# EAGLE design untitled (EAGLE 9.6.2)
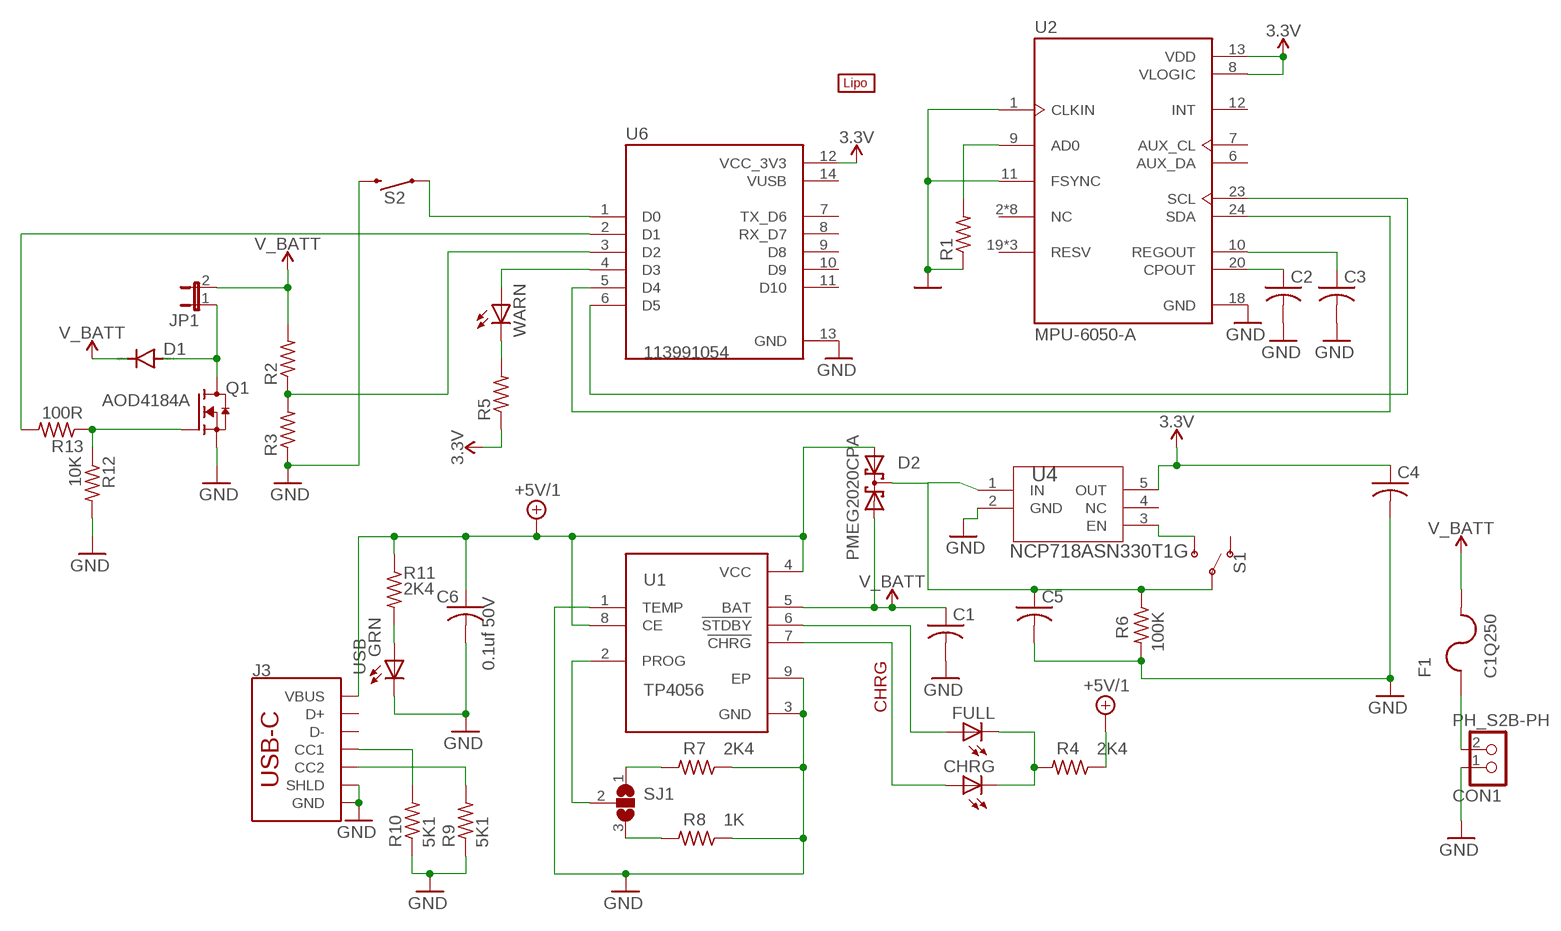
[diagram p0: schematic, sheet 1]

## Parts
BT1  LIPO-OUTLINE1000  [LIPO-1000]
C1  C-USC0603  [C0603]
C2  C-USC0603  [C0603]
C3  C-USC0603  [C0603]
C4  C-USC0603  [C0603]
C5  C-USC0603  [C0603]
C6  0.1uf 50V  C-USC0805  [C0805]
CHRG  LEDCHIPLED_0603  [CHIPLED_0603]
CON1  PH_S2B-PH  [S2B-PH]
D1  DIODE-DO-214AC  [DO-214AC]
D2  PMEG2020CPA  [SOT1061]
F1  C1Q250  [C1Q250]
FULL  LEDCHIPLED_0603  [CHIPLED_0603]
J3  USB Female Type C Connector  USB_C_4-LAYER-ISOLATED  [USB-C-16P-4LAYER-ISOLATED]
JP1  JP1E  [JP1]
Q1  AOD4184A  [DPAK228P994X240-4N]
R1  R-US_R0805  [R0805]
R2  R-US_R0805  [R0805]
R3  R-US_R0805  [R0805]
R4  2K4  R-US_R0603  [R0603]
R5  R-US_R0805  [R0805]
R6  100K  R-US_R0603  [R0603]
R7  2K4  R-US_R0603  [R0603]
R8  1K  R-US_R0603  [R0603]
R9  5K1  R-US_R0603  [R0603]
R10  5K1  R-US_R0603  [R0603]
R11  2K4  R-US_R0603  [R0603]
R12  10K  R-US_R0805  [R0805]
R13  100R  R-US_R0805  [R0805]
S1  SWITCH-SPDT-SMD-RIGHT-ANGLE  [SWITCH_SPST_SMD_A]
S2  MOMENTARY-SWITCH-SPST-PTH-12MM  [TACTILE_SWITCH_PTH_12MM]
SJ1  SJ2W  [SJ_2]
U1  TP4056  [SOP127P600X175-9N]
U2  MPU-6050-A  [QFN50P400X400X95-24N]
U4  NCP718ASN330T1G  [TSOT23-5_ONS]
U6  113991054  [MODULE_113991054]
USB  GRN  LEDCHIPLED_0805  [CHIPLED_0805]
WARN  LEDCHIPLED_0603  [CHIPLED_0603]

## Nets
3.3V: C4.1 R5.1 U2.8(VLOGIC) U2.13(VDD) U4.5(OUT) U6.12(VCC_3V3)
+5V/1: C6.1 D2.1(A1) J3.VBUS1(VBUS) J3.VBUS2(VBUS) R4.1 R11.1 U1.4(VCC) U1.8(CE)
CHRG: CHRG.A U1.7(!CHRG)
FULL: FULL.A U1.6(!STDBY)
GND: C1.2 C2.2 C3.2 C4.2 C5.2 C6.2 CON1.1 J3.GND J3.GND2(GND) J3.SHLD1(SHLD) J3.SHLD2(SHLD) J3.SHLD3(SHLD) J3.SHLD4(SHLD) J3.SHLD5(SHLD) J3.SHLD6(SHLD) J3.SHLD7(SHLD) J3.SHLD8(SHLD) Q1.3(S) R1.1 R3.1 R6.2 R7.1 R8.1 R9.1 R10.1 R12.2 S2.3 U1.1(TEMP) U1.3(GND) U1.9(EP) U2.1(CLKIN) U2.11(FSYNC) U2.18(GND) U4.2(GND) U6.13(GND) USB.C
N$1: C5.1 D2.3(K1K2) R6.1 S1.2(P) U4.1(IN)
N$2: CHRG.C FULL.C R4.2
N$3: U2.23(SCL) U6.6(D5)
N$4: R13.2 U6.2(D1)
N$5: R2.1 R3.2 U6.3(D2)
N$6: S2.1 U6.1(D0)
N$7: U2.24(SDA) U6.5(D4)
N$8: C3.1 U2.10(REGOUT)
N$9: C2.1 U2.20(CPOUT)
N$10: D1.A JP1.1 Q1.4(D)
N$11: CON1.2 F1.1
N$12: R1.2 U2.9(AD0)
N$13: R5.2 WARN.C
N$14: U6.4(D3) WARN.A
N$15: S1.3(S) U4.3(EN)
N$16: J3.A5(CC1) R10.2
N$18: R7.2 SJ1.1
N$19: J3.B5(CC2) R9.2
N$21: R8.2 SJ1.3
N$22: SJ1.2 U1.2(PROG)
N$26: R11.2 USB.A
N$41: Q1.1(G) R12.1 R13.1
V_BATT: C1.1 D1.C D2.2(A2) F1.2 JP1.2 R2.2 U1.5(BAT)
Unconnected: J3.A6(D+) J3.A7(D-) J3.B6(D+) J3.B7(D-) S1.1(O) U2.2(NC) U2.3(NC) U2.4(NC) U2.5(NC) U2.6(AUX_DA) U2.7(AUX_CL) U2.12(INT) U2.14(NC) U2.15(NC) U2.16(NC) U2.17(NC) U2.19(RESV) U2.21(RESV) U2.22(RESV) U4.4(NC) U6.7(TX_D6) U6.8(RX_D7) U6.9(D8) U6.10(D9) U6.11(D10)

## Power pins joined to a net without a drawn wire
VUSB: U6.14(VUSB)

## Library data of the parts
BT1 = SparkFun-Batteries:LIPO-OUTLINE: LiPo Battery Outlines Outlines for common LiPo batteries sold by SparkFun. (Note: no terminals or connection points, just the dimensions.) SparkFun Products Polymer Lithium Ion Battery - 110mAh <https://www.sparkfun.com/products/13853> (PRT-13853) Polymer Lithium Ion Battery - 1000mAh <https://www.sparkfun.com/products/13813> (PRT-13813) Polymer Lithium Ion Battery - 2000mAh <https://www.sparkfun.com/products/8483> (PRT-08483); PROD_ID: BATT-13243; SF_SKU: PRT-13813
C1-C5 = adafruit:C-US: CAPACITOR, American symbol
C6 = rcl:C-US: CAPACITOR, American symbol; SPICEPREFIX: C
CHRG FULL USB WARN = adafruit:LED: LED OSRAM: - CHIPLED LG R971, LG N971, LY N971, LG Q971, LY Q971, LO R971, LY R971 LH N974, LH R974 LS Q976, LO Q976, LY Q976 LO Q996 - Hyper CHIPLED LW Q18S LB Q993, LB Q99A, LB R99A - SideLED LS A670, LO A670, LY A670, LG A670, LP A670 LB A673, LV A673, LT A673, LW A673 LH A674 LY A675 LS A676, LA A676, LO A676, LY A676, LW A676 LS A679, LY A679, LG A679 - Hyper Micro SIDELED® LS Y876, LA Y876, LO Y876, LY Y876 LT Y87S - SmartLED LW L88C, LW L88S LB L89C, LB L89S, LG L890 LS L89K, LO L89K, LY L89K LS L896, LA L896, LO L896, LY L896 - TOPLED LS T670, LO T670, LY T670, LG T670, LP T670 LSG T670, LSP T670, LSY T670, LOP T670, LYG T670 LG T671, LOG T671, LSG T671 LB T673, LV T673, LT T673, LW T673 LH T674 LS T676, LA T676, LO T676, LY T676, LB T676, LH T676, LSB T676, LW T676 LB T67C, LV T67C, LT T67C, LS T67K, LO T67K, LY T67K, LW E67C LS E67B, LA E67B, LO E67B, LY E67B, LB E67C, LV E67C, LT E67C LW T67C LS T679, LY T679, LG T679 LS T770, LO T770, LY T770, LG T770, LP T770 LB T773, LV T773, LT T773, LW T773 LH T774 LS E675, LA E675, LY E675, LS T675 LS T776, LA T776, LO T776, LY T776, LB T776 LHGB T686 LT T68C, LB T68C - Hyper Mini TOPLED® LB M676 - Mini TOPLED Santana® LG M470 LS M47K, LO M47K, LY M47K Source: http://www.osram.convergy.de/
CON1 = CASE-JST:PH_S2B-PH: JST PH Connector, through hole, 2 pin, side entry Description: JST PH connector with 2.0 mm pitch, through hole version, 2 pin, side entry. Links: Datasheet <http://www.jst-mfg.com/product/pdf/eng/ePH.pdf>
D1 = diode:DIODE-: DIODE
D2 = PMEG2020CPA:PMEG2020CPA: Check availability <https://pricing.snapeda.com/parts/PMEG2020CPA/Nexperia/view-part?ref=eda>; AVAILABILITY: In Stock; CHECK_PRICES: https://www.snapeda.com/parts/PMEG2020CPA/Nexperia/view-part/?ref=eda; DESCRIPTION: Diode Array 1 Pair Common Cathode Schottky 20V 2A Surface Mount 3-PowerUDFN; MF: Nexperia; MP: PMEG2020CPA; PACKAGE: PowerUDFN-3 NXP Semiconductors; PRICE: None; SNAPEDA_LINK: https://www.snapeda.com/parts/PMEG2020CPA/Nexperia/view-part/?ref=snap
F1 = Fuse:C1Q250: FUSE BRD MNT 250MA 125VAC 63VDC Manufacturer's datasheet <https://belfuse.com/resources/datasheets/circuitprotection/ds-cp-c1q-series.pdf>; CREATED_BY: PCBLayout.com; DIGIKEY_PARTNO: 507-1073-1-ND; MANUFACTURER: Bel Fuse Inc.; MPN: C1Q 250
J3 = SparkFun-Connectors:USB_C: USB Type C 16Pin Connector Super Speed pins not available on the 16-pin purely SMD connector so this part is best for USB 2.0 implementations. D1 and D2 are tied together enabling D+/- no matter which way the cable is plugged into the connector. The two channel configuration pins (CC1/2) are exposed. These are normally connected to ground via 5.1k resistors but can be reconfigured for high current/high power applications. **4-LAYER BOARD WARNING!!** If designing 4-layer board, make sure to select the variant _4-LAYER-ISOLATED. The linked footprint (USB-C-16-4LAYER-ISOLATED) includes some very necessary cutout polygons in the inner layers (2 and 15). This prevents the PTH mounting shield legs on the USB connector from electrically connecting any other polygons on the inner layers (usually VCC and GND).; PROD_ID: CONN-14122
JP1 = jumper:JP1E: JUMPER
Q1 = AOD4184A:AOD4184A: Trans MOSFET N-CH 40V 50A 3-Pin(2+Tab) DPAK Check availability <https://pricing.snapeda.com/parts/AOD4184A/Alpha%20%26%20Omega%20Semiconductor%20Inc./view-part?ref=eda>; AVAILABILITY: In Stock; CHECK_PRICES: https://www.snapeda.com/parts/AOD4184A/Alpha+%2526+Omega+Semiconductor+Inc./view-part/?ref=eda; DESCRIPTION: N-Channel 40 V 13A (Ta), 50A (Tc) 2.3W (Ta), 50W (Tc) Surface Mount TO-252 (DPAK); MF: Alpha & Omega Semiconductor Inc.; MP: AOD4184A; PACKAGE: None; PRICE: None; SNAPEDA_LINK: https://www.snapeda.com/parts/AOD4184A/Alpha+%2526+Omega+Semiconductor+Inc./view-part/?ref=snap
R1-R3 R5 R9 R10 R12 R13 = adafruit:R-US_: RESISTOR, American symbol
R4 R6-R8 R11 = rcl:R-US_: RESISTOR, American symbol; SPICEPREFIX: R
S1 = SparkFun-Switches:SWITCH-SPDT: Single Pole, Double Throw (SPDT) Switch Single-pole, double-throw (SPDT) switch. Variant Overview SMD-AYZ0202 Surface Mount DPDT Switch <https://www.sparkfun.com/products/597> (COM-00597) Used on e.g. LilyPad Arduino USB - ATmega32U4 Board <https://www.sparkfun.com/products/12049> PTH-11.6X4.0MM SPDT Mini Power Switch <https://www.sparkfun.com/products/102> (COM-00102) Used on e.g. SparkFun Simon Says - Through-Hole Soldering Kit <https://www.sparkfun.com/products/10547> (KIT-10547) PTH-11.6X4.0MM-KIT KIT version of SPDT Mini Power Switch - Simplifies soldering by removing tStop of switch pins - only one side can be soldered. PTH-11.6X4.0MM-LOCK LOCK version of SPDT Mini Power Switch - Offset pins hold switch in place for easier soldering. SMD-RIGHT-ANGLE Surface Mount Right Angle Switch <https://www.sparkfun.com/products/10860> (COM-10860) Used on e.g. SparkFun ESP8266 Thing <https://www.sparkfun.com/products/13231>; PROD_ID: SWCH-10651; SF_SKU: COM-10860
S2 = SparkFun-Switches:MOMENTARY-SWITCH-SPST: Momentary Switch (Pushbutton) - SPST Normally-open (NO) SPST momentary switches (buttons, pushbuttons). Variants PTH-12MM - 12mm square, through-hole Momentary Pushbutton Switch - 12mm Square <https://www.sparkfun.com/products/9190> (COM-09190) PTH-6.0MM, PTH-6.0MM-KIT - 6.0mm square, through-hole Mini Pushbutton Switch <https://www.sparkfun.com/products/97> (COM-00097) KIT package intended for soldering kit's - only one side of pads' copper is exposed. PTH-RIGHT-ANGLE-KIT - Right-angle, through-hole Right Angle Tactile Button <https://www.sparkfun.com/products/10791> - Used on SparkFun BigTime Watch Kit <https://www.sparkfun.com/products/11734> SMD-12MM - 12mm square, surface-mount Tactile Button - SMD (12mm) <https://www.sparkfun.com/products/12993> (COM-12993) Used on SparkFun PicoBoard <https://www.sparkfun.com/products/11888> SMD-4.5MM - 4.5mm Square Trackball Switch Used on SparkFun Blackberry Trackballer Breakout <https://www.sparkfun.com/products/13169> SMD-4.6MMX2.8MM - 4.60mm x 2.80mm, surface mount Used on SparkFun Pro Micro - RP2040 <https://www.sparkfun.com/products/17717> SMD-5.2MM, SMD-5.2-REDUNDANT - 5.2mm square, surface-mount Mini Pushbutton Switch - SMD <https://www.sparkfun.com/products/8720> (COM-08720) Used on Arduino Pro Mini <https://www.sparkfun.com/products/11114> REDUNDANT package connects both switch circuits together SMD-6.0X3.5MM - 6.0 x 3.5mm, surface mount Momentary Reset Switch SMD <https://www.sparkfun.com/products/8229> (COM-08229) SMD-6.2MM-TALL - 6.2mm square, surface mount Tactile Button - SMD (6mm) <https://www.sparkfun.com/products/12992> Used on SparkFun Digital Sandbox <https://www.sparkfun.com/products/12651> SMD-RIGHT-ANGLE - Right-angle, surface mount Used on SparkFun Block for Intel® Edison - Arduino <https://www.sparkfun.com/products/13036>; PROD_ID: SWCH-09185; SF_SKU: COM-09190
SJ1 = jumper:SJ2W: SMD solder JUMPER
U1 = TP4056 (1):TP4056: Complete single cell Li-Ion battery with a constant current / constant voltage linear charger Check availability <https://pricing.snapeda.com/parts/TP4056/NanJing%20Top%20Power%20ASIC%20Corp./view-part?ref=eda>; AVAILABILITY: Not in stock; CHECK_PRICES: https://www.snapeda.com/parts/TP4056/NanJing+Top+Power+ASIC+Corp./view-part/?ref=eda; DESCRIPTION: Complete single cell Li-Ion battery with a constant current / constant voltage linear charger; MF: NanJing Top Power ASIC Corp.; MP: TP4056; PACKAGE: Package; PRICE: None; SNAPEDA_LINK: https://www.snapeda.com/parts/TP4056/NanJing+Top+Power+ASIC+Corp./view-part/?ref=snap
U2 = MPU-6050-A:MPU-6050-A: Check availability <https://pricing.snapeda.com/parts/MPU-6050-A/TDK%20InvenSense/view-part?ref=eda>; AVAILABILITY: In Stock; CHECK_PRICES: https://www.snapeda.com/parts/MPU-6050-A/TDK/view-part/?ref=eda; DESCRIPTION: MOTION TRACKING DEVICE; MF: TDK InvenSense; MP: MPU-6050-A; PACKAGE: QFN-24 InvenSense; PRICE: None; SNAPEDA_LINK: https://www.snapeda.com/parts/MPU-6050-A/TDK/view-part/?ref=snap
U4 = NCP718ASN330T1G:NCP718ASN330T1G: Check availability <https://pricing.snapeda.com/parts/NCP718ASN330T1G/onsemi/view-part?ref=eda>; AVAILABILITY: In Stock; CHECK_PRICES: https://www.snapeda.com/parts/NCP718ASN330T1G/Onsemi/view-part/?ref=eda; DESCRIPTION: Linear Voltage Regulator IC Positive Fixed 1 Output 300mA TSOT-23-5; MF: onsemi; MP: NCP718ASN330T1G; PACKAGE: TSOT-23-5 ON Semiconductor; PRICE: None; SNAPEDA_LINK: https://www.snapeda.com/parts/NCP718ASN330T1G/Onsemi/view-part/?ref=snap
U6 = 113991054:113991054: Check availability <https://pricing.snapeda.com/parts/113991054/Seeed%20Technology%20Co.%2C%20Ltd/view-part?ref=eda>; AVAILABILITY: In Stock; CHECK_PRICES: https://www.snapeda.com/parts/113991054/Seeed+Studio/view-part/?ref=eda; DESCRIPTION: - ESP32-C3 Transceiver; 802.11 a/b/g/n (Wi-Fi, WiFi, WLAN), Bluetooth® Smart 4.x Low Energy (BLE) 2.4GHz Evaluation Board; MF: Seeed Technology Co., Ltd; MP: 113991054; PACKAGE: None; PRICE: None; SNAPEDA_LINK: https://www.snapeda.com/parts/113991054/Seeed+Studio/view-part/?ref=snap

## Board
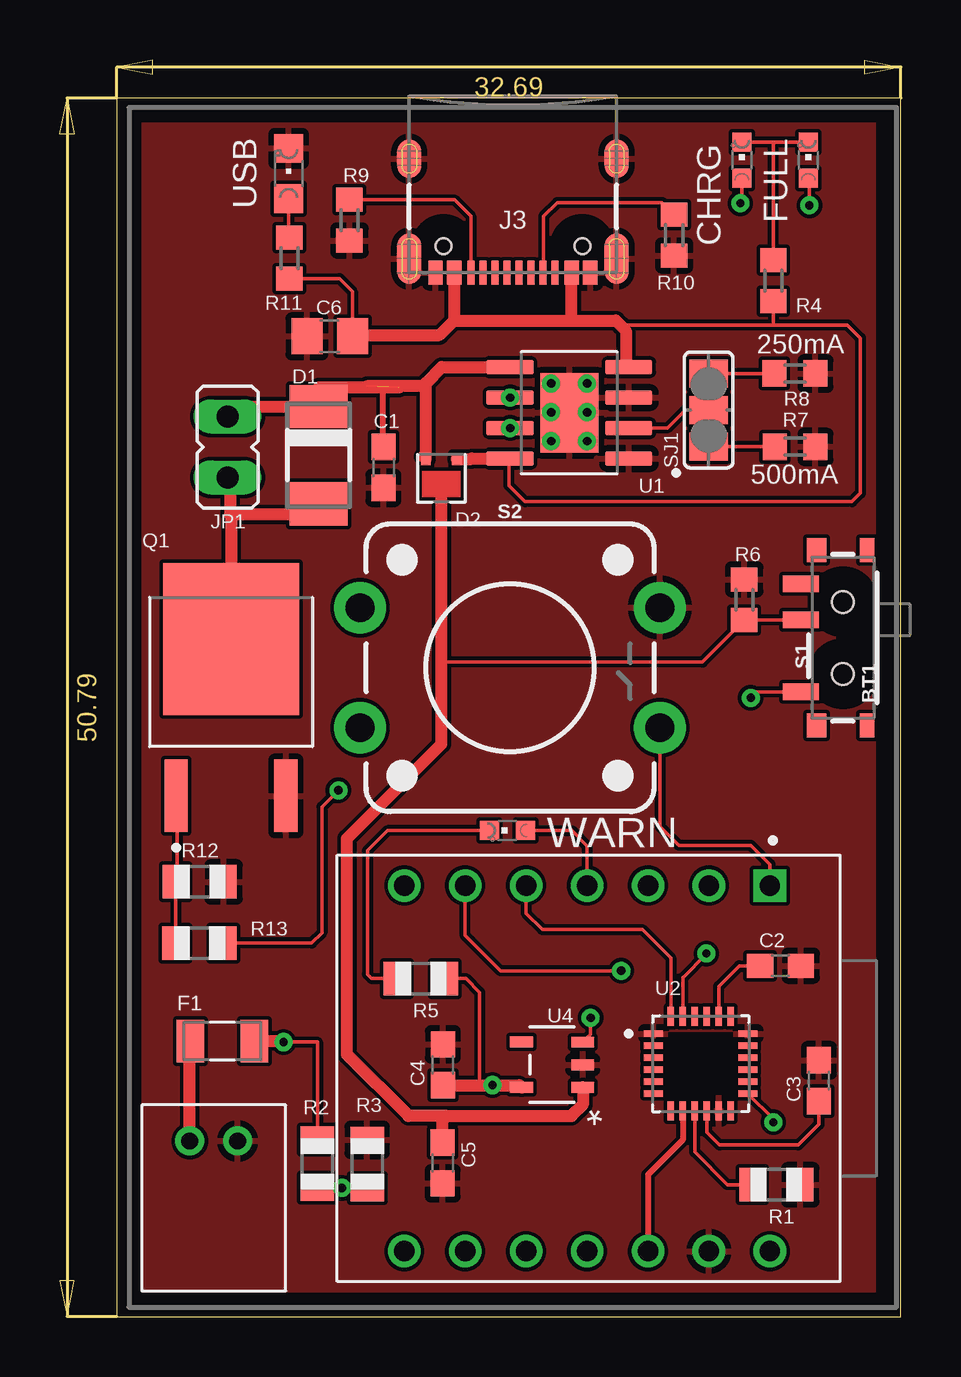
[diagram p1: board, top side]
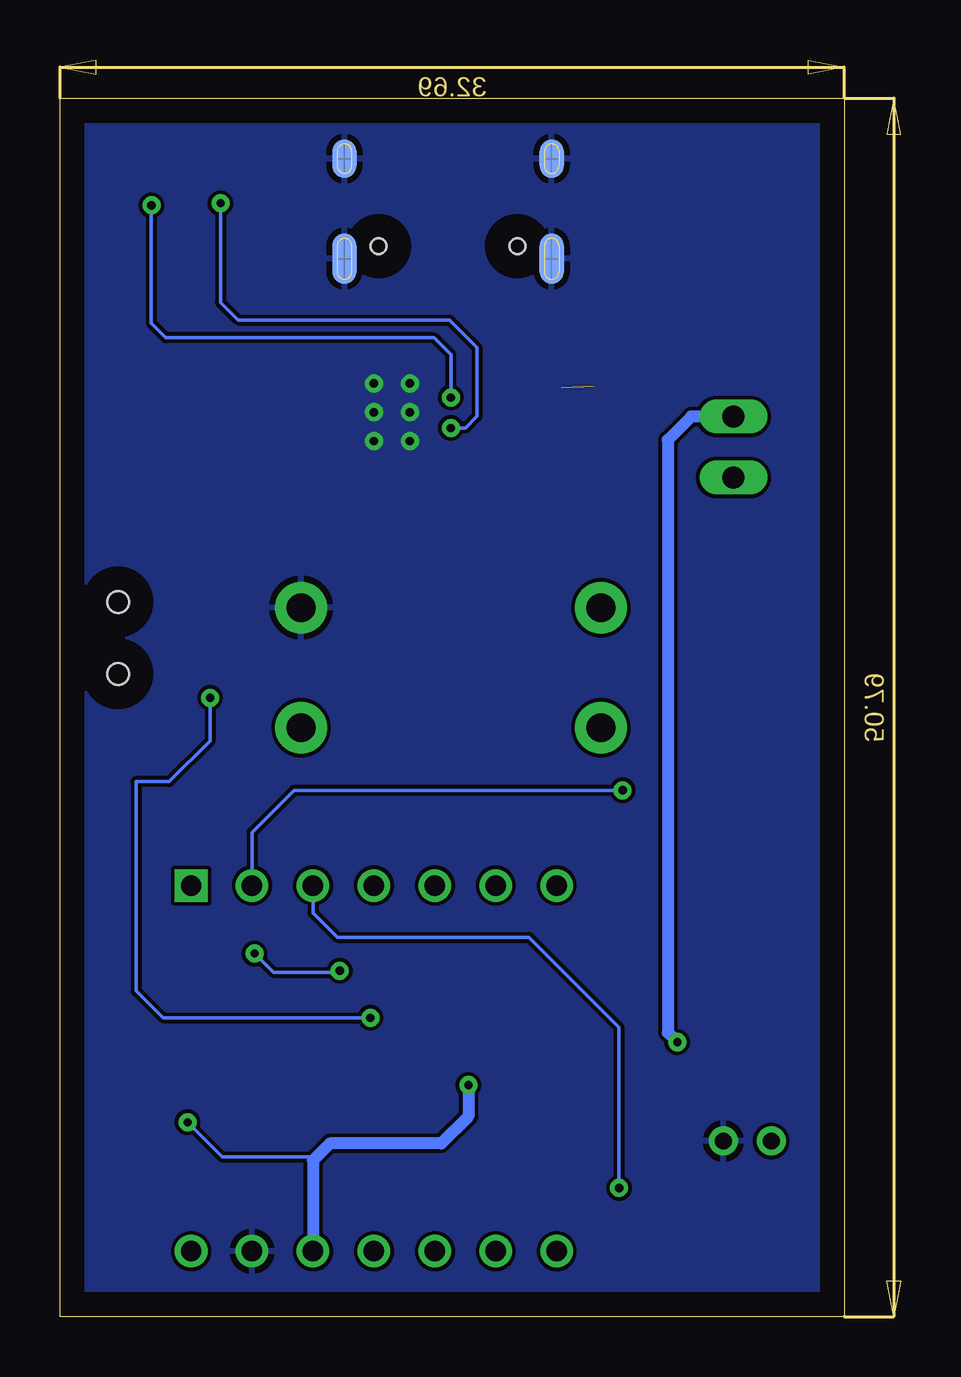
[diagram p2: board, bottom side, seen from below]

Size 32.69 x 50.79 mm. Coordinates in mm from the lower left corner, seen from the top.
Outline: 0,0 32.69,0 32.69,50.79 0,50.79 0,0
Copper layers (1*16): Top 0.035mm / dielectric 1.5mm / Bottom 0.035mm
Design rules "default": minimum track width 6mil, minimum drill 0.35mm, track to track 6mil, track to pad 6mil, pad to pad 6mil, via to via 6mil, smd to smd 6mil, copper to edge 40mil, drill to drill 6mil, minimum pad ring 10mil, minimum via ring 8mil, stop-mask expansion 4mil, vias tented up to drill 0mil, thermal gap 10mil

### Footprints (pad centres in the part's own frame; a part is rotated, then mirrored left to right if it is on the bottom)
C0603 = smd 1.1 x 1: 1 -0.85,0; 2 0.85,0
C0805 = smd 1.3 x 1.5: 1 -0.95,0; 2 0.95,0
CHIPLED_0603 = smd 0.8 x 0.8: A 0,-0.75; C 0,0.75
S2B-PH = drill 0.7: 1 -1,0; 2 1,0
DO-214AC = smd 1.8 x 2.4: A 2.025,0; C -2.025,0
SOT1061 = smd 0.4 x 0.5: 1 -0.65,-0.8; 2 0.65,-0.8 | smd 0 x 0: 3 0,0.875
C1Q250 = smd 1.14 x 1.78: 1 -1.33,0; 2 1.33,0
USB-C-16P-4LAYER-ISOLATED = smd 0.3 x 1: A5 -1.25,-0.34; A6 -0.25,-0.34; A7 0.25,-0.34; A8 1.25,-0.34; B5 1.75,-0.34; B6 0.75,-0.34; B7 -0.75,-0.34; B8 -1.75,-0.34 | smd 0.6 x 1: GND -3.225,-0.34; GND2 3.225,-0.34; VBUS1 -2.45,-0.34; VBUS2 2.45,-0.34 | smd 1 x 2.1: SHLD1 -4.32,-0.915; SHLD2 4.32,-0.915 | smd 1 x 2.1 bottom: SHLD3 -4.32,-0.915; SHLD4 4.32,-0.915 | smd 1 x 1.6: SHLD5 -4.32,-5.095; SHLD8 4.32,-5.095 | smd 1 x 1.6 bottom: SHLD6 -4.32,-5.095; SHLD7 4.32,-5.095 | hole 0.65: -2.89,-1.445; 2.89,-1.445
JP1 = drill 0.914 long: 1 0,-1.27; 2 0,1.27
DPAK228P994X240-4N = smd 0.97 x 3.02: 1 -2.286,-4.09; 3 2.286,-4.09 | smd 5.67 x 6.32: 4 0,2.44
R0805 = smd 1.1 x 1.4: 1 -1,0; 2 1,0
R0603 = smd 1 x 1.1: 1 -0.85,0; 2 0.85,0
SWITCH_SPST_SMD_A = smd 0.7 x 1.5: 1 -2.25,-1.75; 2 -0.75,-1.75; 3 2.25,-1.75 | smd 1 x 0.6: GND1 -3.65,1; GND3 3.65,1 | smd 1 x 0.8: GND2 -3.65,-1.1; GND4 3.65,-1.1 | hole 0.9: -1.5,0; 1.5,0
TACTILE_SWITCH_PTH_12MM = drill 1.2 pad 2.159: 1 6.25,-2.5; 2 -6.25,-2.5; 3 6.25,2.5; 4 -6.25,2.5
SJ_2 = smd 1.168 x 1.6: 1 -1.524,0; 2 0,0; 3 1.524,0
SOP127P600X175-9N = smd 1.97 x 0.6: 1 -2.475,1.905; 2 -2.475,0.635; 3 -2.475,-0.635; 4 -2.475,-1.905; 5 2.475,-1.905; 6 2.475,-0.635; 7 2.475,0.635; 8 2.475,1.905 | smd 2.413 x 3.302: 9 0,0
QFN50P400X400X95-24N = smd 0.79 x 0.28: 1 -1.97,1.25; 2 -1.97,0.75; 3 -1.97,0.25; 4 -1.97,-0.25; 5 -1.97,-0.75; 6 -1.97,-1.25; 13 1.97,-1.25; 14 1.97,-0.75; 15 1.97,-0.25; 16 1.97,0.25; 17 1.97,0.75; 18 1.97,1.25 | smd 0.28 x 0.79: 7 -1.25,-1.97; 8 -0.75,-1.97; 9 -0.25,-1.97; 10 0.25,-1.97; 11 0.75,-1.97; 12 1.25,-1.97; 19 1.25,1.97; 20 0.75,1.97; 21 0.25,1.97; 22 -0.25,1.97; 23 -0.75,1.97; 24 -1.25,1.97
TSOT23-5_ONS = smd 0.953 x 0.457: 1 -1.276,0.94; 2 -1.276,0; 3 -1.276,-0.94; 4 1.276,-0.953; 5 1.276,0.953
MODULE_113991054 = drill 0.85 square: 1 -7.62,7.556 | drill 0.85: 2 -7.62,5.016; 3 -7.62,2.477; 4 -7.62,-0.064; 5 -7.62,-2.603; 6 -7.62,-5.144; 7 -7.62,-7.684; 8 7.62,-7.684; 9 7.62,-5.144; 10 7.62,-2.603; 11 7.62,-0.064; 12 7.62,2.477; 13 7.62,5.016; 14 7.62,7.556
CHIPLED_0805 = smd 1.2 x 1.2: A 0,-1.05; C 0,1.05

### Placement (x,y rotation side)
BT1  16.51,25.4 0 top
C1  11.11,35.4 270 top
C2  27.66,14.63 0 top
C3  29.27,9.84 90 top
C4  13.59,10.5 90 top
C5  13.58,6.41 270 top
C6  8.88,40.86 180 top
CHRG  26.05,48.21 0 top
CON1  4.04,7.32 180 top
D1  8.41,35.91 270 top
D2  13.53,34.95 180 top
F1  4.4,11.49 0 top
FULL  28.82,48.21 0 top
J3  16.51,43.18 180 top
JP1  4.61,36.25 0 top
Q1  4.76,25.8 0 top
R1  27.49,5.5 180 top
R2  8.37,6.38 90 top
R3  10.43,6.37 270 top
R4  27.37,43.19 90 top
R5  12.66,14.1 180 top
R6  26.16,29.88 90 top
R7  28.27,36.26 180 top
R8  28.27,39.31 180 top
R9  9.7,45.71 90 top
R10  23.23,45.08 90 top
R11  7.2,44.12 90 top
R12  3.45,18.13 0 top
R13  3.45,15.58 0 top
S1  30.27,28.3 270 top
S2  16.39,27.05 0 top
SJ1  24.67,37.79 90 top
U1  18.87,37.68 180 top
U2  24.34,10.55 0 top
U4  18.15,10.51 180 top
U6  19.67,10.35 270 top
USB  7.16,47.65 0 top
WARN  16.28,20.27 90 top

### Tracks (layer width: path | path; a pad name or v marks a point on that pad's centre or on a via)
3.3V  (via drill 0.35)
  Top 0.152: R5.1 14.55,14.1 15.12,13.53 15.12,9.65 | U2.13 27.37,8.24 v27.37,8.1
  Top 0.254: U2.8 23.59,7.37 22.14,5.92 U6.12
  Top 0.508: C4.1 15.12,9.65 v15.66,9.65 16.77,9.65 U4.5
  Bottom 0.152: v27.37,8.1 25.93,6.66 22,6.66
  Bottom 0.508: v15.66,9.65 15.66,8.36 16.8,7.23 21.43,7.23 22,6.66 22.14,6.52 U6.12
+5V/1
  Top 0.152: 16.34,35.77 16.34,34.65 17.02,33.97 30.64,33.97 31,34.33 31,40.8 30.46,41.34 27.32,41.34 | R11.1 9.28,43.27 9.82,42.72 C6.1 | 21.01,41.31 21.03,41.34 27.32,41.34 | R4.1 27.37,41.39 27.32,41.34
  Top 0.508: U1.4 21.22,39.71 21.22,41.1 21.01,41.31 20.8,41.52 18.96,41.52 | 18.96,41.52 J3.VBUS1 | C6.1 9.88,40.92 13.45,40.92 14.05,41.52 | 14.05,41.52 18.96,41.52 | J3.VBUS2 14.06,41.53 14.05,41.52 | U1.8 16.34,35.77 14.8,35.77 14.79,35.76 D2.1
CHRG  (via drill 0.35)
  Top 0.152: CHRG.A 26.05,46.47 v25.99,46.41
  Bottom 0.152: v25.99,46.41 25.99,42.28 25.26,41.54 16.45,41.54 15.3,40.38 15.3,37.53 15.79,37.04 U1.7
  other vias: 16.39,37.04
FULL  (via drill 0.35)
  Top 0.152: FULL.A 28.87,47.41 v28.87,46.33
  Bottom 0.152: U1.6 16.39,40.1 17.1,40.81 28.28,40.81 28.88,41.42 28.88,46.31 v28.87,46.33
  other vias: 16.39,38.31
GND  (via drill 0.35)
  other vias: 18.1,38.9 18.1,37.7 18.1,36.5 19.6,38.9 19.6,37.7 19.6,36.5
  pour Top: 0.19,50.62 32.52,50.62 32.52,0.18 0.2,0.18 0.2,50.62
  pour Bottom: 0.16,50.88 32.53,50.88 32.53,0.19 0.16,0.19 0.16,50.88
N$1
  Top 0.152: S1.2 28.5,29.03 R6.1 24.41,27.29 13.53,27.29
  Top 0.508: 13.76,8.37 18.95,8.37 19.42,8.83 U4.1 | C5.1 13.58,8.18 13.76,8.37 | 13.76,8.37 12.15,8.37 9.59,10.93 9.59,19.93 13.53,23.87 13.53,27.29 D2.3
N$2
  Top 0.152: FULL.C | FULL.C 27.44,48.95 | 27.44,48.95 CHRG.C | R4.2 27.37,48.88 27.44,48.95
N$3  (via drill 0.35)
  Top 0.152: U2.23 23.59,14.13 | 23.59,14.13 | v21.03,14.42 15.99,14.42 14.52,15.89 U6.6 | v24.58,15.14 24.58,15.12 23.59,14.13
  Bottom 0.152: v24.58,15.14 23.79,14.36 21.09,14.36 v21.03,14.42
N$4  (via drill 0.35)
  Top 0.152: v9.24,21.94 8.55,21.25 8.55,16 8.12,15.58 R13.2
  Bottom 0.152: U6.2 24.68,20.19 22.93,21.94 v9.24,21.94
N$5  (via drill 0.35)
  Top 0.152: R3.2 v9.38,5.37 8.38,5.37 R2.1
  Bottom 0.152: U6.3 22.14,16.83 21.12,15.81 13.14,15.81 9.38,12.05 v9.38,5.37
N$6
  Top 0.152: U6.1 27.22,18.85 26.43,19.65 23.42,19.65 22.64,20.43 S2.1
N$7
  Top 0.152: U6.5 17.06,16.82 17.74,16.14 21.91,16.14 23.09,14.96 U2.24
N$8
  Top 0.152: C3.1 29.27,8.02 28.41,7.16 25.12,7.16 24.59,7.68 U2.10
N$9
  Top 0.152: U2.20 25.09,13.77 25.95,14.63 C2.1
N$10
  Top 0.508: JP1.1 4.72,34.87 4.72,33.43 4.76,33.43 | 4.76,33.43 Q1.4 | D1.A 7.96,33.43 4.76,33.43
N$11
  Top 0.508: 2.9,11.66 F1.1 3.04,11.46 CON1.2
N$12
  Top 0.152: R1.2 25.45,5.5 24.09,6.87 U2.9
N$13
  Top 0.152: WARN.C 11.28,20.27 10.45,19.43 10.45,14.27 10.62,14.1 R5.2
N$14
  Top 0.152: WARN.A 18.96,20.27 19.6,19.63 U6.4
N$15  (via drill 0.35)
  Top 0.152: S1.3 26.63,26.05 26.4,25.82 v26.43,25.79 | v19.75,12.46 19.75,11.77 U4.3
  Bottom 0.152: v26.43,25.79 26.43,24.01 28.13,22.31 29.52,22.31 29.52,13.58 28.39,12.46 v19.75,12.46
N$16
  Top 0.152: R10.2 22.73,46.44 18.36,46.44 17.79,45.87 17.79,43.55 J3.A5
N$18
  Top 0.152: R7.2 SJ1.1
N$19
  Top 0.152: R9.2 14.07,46.56 14.76,45.87 J3.B5
N$21
  Top 0.152: R8.2 SJ1.3
N$22
  Top 0.152: SJ1.2 23.7,37.79 22.95,37.04 U1.2
N$26
  Top 0.152: USB.A 7.16,45.01 R11.2
N$41
  Top 0.152: Q1.1 2.51,21.68 2.51,18.19 R12.1 R13.1
V_BATT  (via drill 0.35)  (1 unrouted)
  Top 0.152: v6.95,11.45 8.37,11.45 R2.2
  Top 0.254: C1.1 11.11,38.78
  Top 0.508: 12.88,38.92 D2.2 12.78,35.86 | 12.88,38.92 13.54,39.58 U1.5 | 12.88,38.92 12.74,38.78 11.11,38.78 10.43,38.78 | 11.77,38.73 8.41,38.73 D1.C 5.02,37.93 JP1.2 | F1.2 6.91,11.49 v6.95,11.45
  Bottom 0.508: JP1.2 6.38,37.52 7.35,36.54 7.35,11.85 v6.95,11.45

### Text on the board
tPlace: 250mA | 500mA